# Altium schematic sheet Connector-USB-Current-Limit.SchDoc
size A4; SheetNumber: 2; SheetTotal: 5
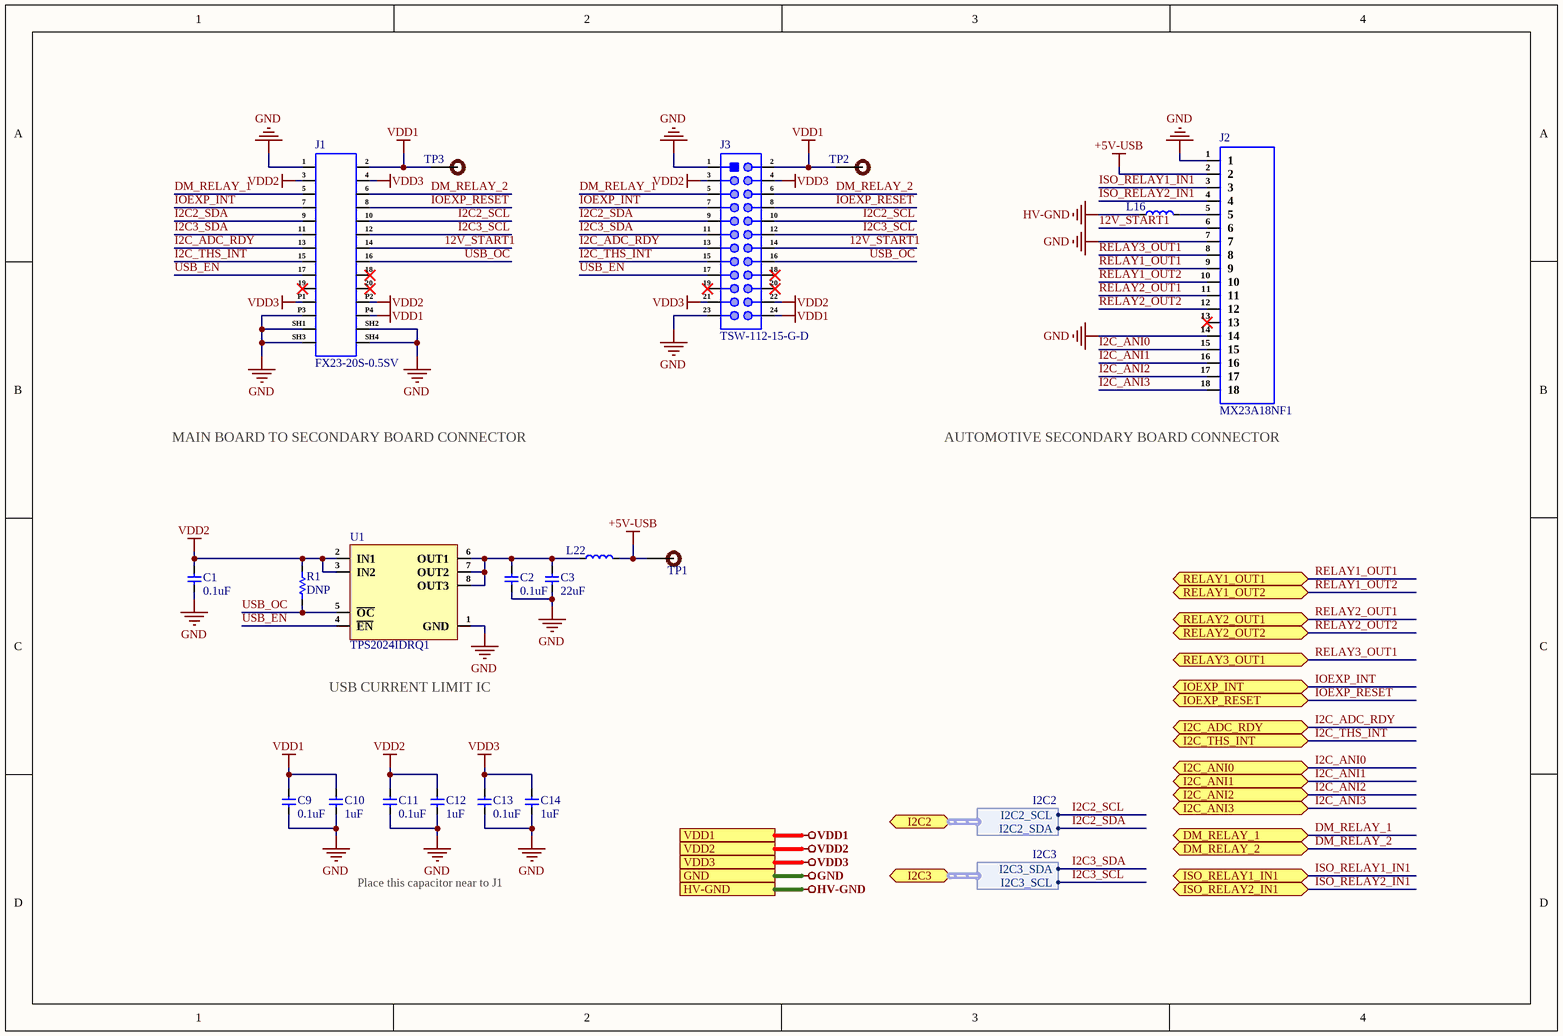
[diagram p0: Connector-USB-Current-Limit.SchDoc]

## Parts
C1  0.1uF  [Cap-0402]
C2  0.1uF  [Cap-0402]
C3  22uF  [Cap-0603]
C9  0.1uF  [Cap-0402]
C10  1uF  [Cap-0603]
C11  0.1uF  [Cap-0402]
C12  1uF  [Cap-0603]
C13  0.1uF  [Cap-0402]
C14  1uF  [Cap-0603]
J1  FX23-20S-0.5SV  [FX23-20S-0.5SV]
J2  MX23A18NF1  [MX23A18NF1]
J3  TSW-112-15-G-D  [TSW-112-15-G-D]
L16  BLM21SP601SH1D  [Ind-0805]  (value not drawn)
L22  BLM21SP601SH1D  [Ind-0805]  (value not drawn)
R1  DNP  [Res-0603]
TP1  DNP  [Test-point]  (value not drawn)
TP2  DNP  [Test-point]  (value not drawn)
TP3  DNP  [Test-point]  (value not drawn)
U1  TPS2024IDRQ1  [SOIC-8]

## Ports
DM_RELAY_1 (bidir, see Top-Sheet[3B], ISOLATED-RELAYS[4D]), DM_RELAY_2 (bidir, see Top-Sheet[3B], ISOLATED-RELAYS[4D]), GND (see Top-Sheet[2B], I2C-To-GPIO-Expander[1D], ISOLATED-RELAYS[1D], TEMP-HUMIDITY[1D]), HV-GND (see Top-Sheet[2B], ISOLATED-RELAYS[1D]), I2C2 (bidir, harness I2C2, see Top-Sheet[2C], I2C-To-GPIO-Expander[2D]), I2C3 (bidir, harness I2C3, see Top-Sheet[3C], TEMP-HUMIDITY[1D]), I2C_ADC_RDY (bidir, see Top-Sheet[3C], TEMP-HUMIDITY[2D]), I2C_ANI0 (bidir, see Top-Sheet[3C], TEMP-HUMIDITY[2D]), I2C_ANI1 (bidir, see Top-Sheet[3C], TEMP-HUMIDITY[2D]), I2C_ANI2 (bidir, see Top-Sheet[3C], TEMP-HUMIDITY[2D]), I2C_ANI3 (bidir, see Top-Sheet[3C], TEMP-HUMIDITY[2D]), I2C_THS_INT (bidir, see Top-Sheet[3C], TEMP-HUMIDITY[2D]), IOEXP_INT (bidir, see Top-Sheet[2C], I2C-To-GPIO-Expander[2D]), IOEXP_RESET (bidir, see Top-Sheet[2C], I2C-To-GPIO-Expander[2D]), ISO_RELAY1_IN1 (bidir, see Top-Sheet[3B], ISOLATED-RELAYS[4D]), ISO_RELAY2_IN1 (bidir, see Top-Sheet[3B], ISOLATED-RELAYS[4D]), RELAY1_OUT1 (bidir, see Top-Sheet[2C], I2C-To-GPIO-Expander[2C]), RELAY1_OUT2 (bidir, see Top-Sheet[2C], I2C-To-GPIO-Expander[2D]), RELAY2_OUT1 (bidir, see Top-Sheet[2C], I2C-To-GPIO-Expander[2D]), RELAY2_OUT2 (bidir, see Top-Sheet[2C], I2C-To-GPIO-Expander[2D]), RELAY3_OUT1 (bidir, see Top-Sheet[2C], I2C-To-GPIO-Expander[2D]), VDD1 (see Top-Sheet[2B], I2C-To-GPIO-Expander[1D]), VDD2 (see Top-Sheet[2C], I2C-To-GPIO-Expander[1D]), VDD3 (see Top-Sheet[2C], I2C-To-GPIO-Expander[1D], TEMP-HUMIDITY[1D])

## Harnesses
I2C3: I2C3_SDA, I2C3_SCL
I2C2: I2C2_SCL, I2C2_SDA

## Nets
+5V-USB: J2.2 L22.2 TP1.1
GND: C1.1 C2.1 C3.1 C9.1 C10.1 C11.1 C12.1 C13.1 C14.1 J1.1 J1.P3 J1.SH1 J1.SH2 J1.SH3 J1.SH4 J2.1 J2.7 J2.14 J3.1 J3.23 U1.1(GND) ; port GND
HV-GND: L16.1 ; port HV-GND
VDD1: C9.2 C10.2 J1.2 J1.P4 J3.2 J3.24 TP2.1 TP3.1 ; port VDD1
VDD2: C1.2 C11.2 C12.2 J1.3 J1.P2 J3.3 J3.22 R1.2 U1.2(IN1) U1.3(IN2) ; port VDD2
VDD3: C13.2 C14.2 J1.4 J1.P1 J3.4 J3.21 ; port VDD3
12V_START1: J1.14 J2.6 J3.14
DM_RELAY_1: J1.5 J3.5 ; port DM_RELAY_1
DM_RELAY_2: J1.6 J3.6 ; port DM_RELAY_2
I2C2_SCL: J1.10 J3.10 ; port I2C2.I2C2_SCL
I2C2_SDA: J1.9 J3.9 ; port I2C2.I2C2_SDA
I2C3_SCL: J1.12 J3.12 ; port I2C3.I2C3_SCL
I2C3_SDA: J1.11 J3.11 ; port I2C3.I2C3_SDA
I2C_ADC_RDY: J1.13 J3.13 ; port I2C_ADC_RDY
I2C_ANI0: J2.15 ; port I2C_ANI0
I2C_ANI1: J2.16 ; port I2C_ANI1
I2C_ANI2: J2.17 ; port I2C_ANI2
I2C_ANI3: J2.18 ; port I2C_ANI3
I2C_THS_INT: J1.15 J3.15 ; port I2C_THS_INT
IOEXP_INT: J1.7 J3.7 ; port IOEXP_INT
IOEXP_RESET: J1.8 J3.8 ; port IOEXP_RESET
ISO_RELAY1_IN1: J2.3 ; port ISO_RELAY1_IN1
ISO_RELAY2_IN1: J2.4 ; port ISO_RELAY2_IN1
RELAY1_OUT1: J2.9 ; port RELAY1_OUT1
RELAY1_OUT2: J2.10 ; port RELAY1_OUT2
RELAY2_OUT1: J2.11 ; port RELAY2_OUT1
RELAY2_OUT2: J2.12 ; port RELAY2_OUT2
RELAY3_OUT1: J2.8 ; port RELAY3_OUT1
USB_EN: J1.17 J3.17 U1.4(~{EN})
USB_OC: J1.16 J3.16 R1.1 U1.5(~{OC})
NetC2_2: C2.2 C3.2 L22.1 U1.6(OUT1) U1.7(OUT2) U1.8(OUT3)
NetJ2_5: J2.5 L16.2

Not connected (* = marked no-connect by the designer): J1 18* 19* 20*; J2 13*; J3 18* 19* 20*

## Notes on the sheet
- MAIN BOARD TO SECONDARY BOARD CONNECTOR
- (near J2) AUTOMOTIVE SECONDARY BOARD CONNECTOR
- (near U1) USB CURRENT LIMIT IC
- Place this capacitor near to J1

## Library data of the parts
C1 C2 C9 C11 C13 = GRM155R71C104KA88J: CAP CER 0.1UF 16V X7R 0402; Manufacturer: Murata; Material: 4241ConductorMaterial; Value: 100nF; Tolerance: 10%; Supplier: Arrow Electronics; Supplier Part Number: GRM155R71C104KA88J; Manufacturer Part Number: GRM155R71C104KA88J; RoHS: Yes; Category: Ceramic Capacitors; Stock: 300000; Pricing: 50000=0.004, 100000=0.0034, 150000=0.0033 (USD); Mounting Technology: Surface Mount; Case/Package: 0402; Pins: 2NUMBER; Case Code (Metric): 1005; Case Code (Imperial): 0402; Min Operating Temperature: -55°C; Max Operating Temperature: 125°C; Package Quantity: 1; Voltage Rating: 16V; Packaging: Tape and Reel; Dielectric: X7R; Voltage Rating (DC): 16V; Termination: SMD/SMT; Voltage: 16V; Series: GRM; Construction: Flat; Length: 1mm; Width: 0.02inch; Height: 0.5mm; Thickness: 0.022inch; Depth: 0.5mm; Radiation Hardening: No; Reach SVHC Compliant: No; Lead Free: Lead Free; RoHS Compliant: Yes; ComponentLink1URL: https://datasheet.ciiva.com/6271/product-6271168.pdf?src-supplier=Digi-Key; ComponentLink1Description: https://datasheet.ciiva.com/6271/product-6271168.pdf?src-supplier=Digi-Key; ComponentLink2URL: https://datasheet.ciiva.com/6271/grm155r71c104ka88-01-6271231.pdf?src-supplier=Digi-Key; ComponentLink2Description: https://datasheet.ciiva.com/6271/grm155r71c104ka88-01-6271231.pdf?src-supplier=Digi-Key
C3 = CL10A226MO7JZNC: CAP CER 22UF 16V X5R 0603; Manufacturer: Samsung; Tolerance: 20%; Supplier: Avnet; Supplier Part Number: CL10A226MO7JZNC; Manufacturer Part Number: CL10A226MO7JZNC; RoHS: Yes; Category: Ceramic Capacitors; Stock: 1192000; Pricing: 4000=0.1372 (USD); Mounting Technology: Surface Mount; Case/Package: 0603; Case Code (Imperial): 0603; Case Code (Metric): 1608; Min Operating Temperature: -55°C; Max Operating Temperature: 85°C; Packaging: Cut Tape; Value: 22uF; Voltage Rating: 16V; Series: CL; RoHS Compliant: Yes; ComponentLink1URL: http://www.samsungsem.com/kr/support/product-search/mlcc/CL10A226MO7JZNC.jsp?src-supplier=Digi-Key; ComponentLink1Description: http://www.samsungsem.com/kr/support/product-search/mlcc/CL10A226MO7JZNC.jsp?src-supplier=Digi-Key; ComponentLink2URL: https://datasheet.octopart.com/CL10A226MO7JZNC-Samsung-Electro-Mechanics-datasheet-149156497.pdf?src-supplier=Future+Electronics; ComponentLink2Description: https://datasheet.octopart.com/CL10A226MO7JZNC-Samsung-Electro-Mechanics-datasheet-149156497.pdf?src-supplier=Future+Electronics
C10 C12 C14 = CGA3E1X7R1E105K080AC: CAP CER 1UF 25V X7R 0603; Manufacturer: TDK; Material: 4241ConductorMaterial; Tolerance: 10%; Supplier: Rs; Supplier Part Number: 7882925P; Manufacturer Part Number: CGA3E1X7R1E105K080AC; RoHS: Yes; Category: Ceramic Capacitors; Stock: 80700; Pricing: 800=0.027, 2000=0.026 (GBP); Mounting Technology: Surface Mount; Case/Package: 0603; Case Code (Metric): 1608; Case Code (Imperial): 0603; Weight: 7.1E-05oz; Min Operating Temperature: -55°C; Max Operating Temperature: 125°C; Value: 1uF; Packaging: Tape and Reel; Dielectric: X7R; Voltage Rating: 25V; Package Quantity: 1; Voltage Rating (DC): 25V; Termination: SMD/SMT; Voltage: 25V; Series: CGA; Length: 1.6mm; Width: 0.031inch; Height: 0.8mm; Depth: 0.8mm; Thickness: 0.035inch; Ratings: AEC-Q200; Lead Free: Lead Free; Reach SVHC Compliant: No; RoHS Compliant: Yes; ComponentLink1URL: https://datasheet.ciiva.com/24216/cga3e1x7r1e105k080ac-265757-24216362.pdf?src-supplier=Mouser; ComponentLink1Description: https://datasheet.ciiva.com/24216/cga3e1x7r1e105k080ac-265757-24216362.pdf?src-supplier=Mouser; ComponentLink2URL: https://datasheet.ciiva.com/23803/1936565-23803078.pdf?src-supplier=Newark; ComponentLink2Description: https://datasheet.ciiva.com/23803/1936565-23803078.pdf?src-supplier=Newark; ComponentLink3URL: https://datasheet.ciiva.com/46385/1735392-46385705.pdf?src-supplier=Element14; ComponentLink3Description: https://datasheet.ciiva.com/46385/1735392-46385705.pdf?src-supplier=Element14; ComponentLink4URL: https://datasheet.ciiva.com/48573/2288cga3e1x7r1e105k080ac-48573708.pdf?src-supplier=Onlinecomponents.com; ComponentLink4Description: https://datasheet.ciiva.com/48573/2288cga3e1x7r1e105k080ac-48573708.pdf?src-supplier=Onlinecomponents.com; ComponentLink5URL: https://datasheet.ciiva.com/16428/mlccspec-automotive-general-midvoltage-en-16428542.pdf?src-supplier=Future+Electronics; ComponentLink5Description: https://datasheet.ciiva.com/16428/mlccspec-automotive-general-midvoltage-en-16428542.pdf?src-supplier=Future+Electronics
J1 = FX23-20S-0.5SV: CONN RCPT 20POS SMD GOLD; Manufacturer: Hirose; Supplier: Future Electronics; Supplier Part Number: 9113545; Manufacturer Part Number: FX23-20S-0.5SV; RoHS: Yes; Category: Board to Board Connectors; Stock: 84; Pricing: 84=1.74, 252=1.69, 336=1.68, 840=1.65, 1260=1.61 (USD); ComponentLink1URL: https://datasheet.octopart.com/FX23-20S-0.5SV-Hirose-datasheet-147827136.pdf?src-supplier=Future+Electronics; ComponentLink1Description: https://datasheet.octopart.com/FX23-20S-0.5SV-Hirose-datasheet-147827136.pdf?src-supplier=Future+Electronics; ComponentLink2URL: https://www.hirose.com/product/en/download_file/key_name/FX23-20S-0.5SV/category/Specification%20Sheet/doc_file_id/88096/?file_category_id=9&item_id=05733201000&is_series=&src-supplier=Digi-Key; ComponentLink2Description: https://www.hirose.com/product/en/download_file/key_name/FX23-20S-0.5SV/category/Specification%20Sheet/doc_file_id/88096/?file_category_id=9&item_id=05733201000&is_series=&src-supplier=Digi-Key; ComponentLink3URL: https://datasheet.octopart.com/FX23-20S-0.5SV-Hirose-datasheet-155938459.pdf?src-supplier=Sager+Electronics; ComponentLink3Description: https://datasheet.octopart.com/FX23-20S-0.5SV-Hirose-datasheet-155938459.pdf?src-supplier=Sager+Electronics
J2 = MX23A18NF1: CONN HEADER R/A 18POS 2.5MM; Manufacturer: JAE Electronics; Supplier: Rs; Supplier Part Number: 435784; Manufacturer Part Number: MX23A18NF1; RoHS: Yes; Category: Connectors; Stock: 117; Pricing: 1=6.45, 10=6.27, 25=6.1, 50=5.93, 75=5.78 (GBP); ComponentLink1URL: https://datasheet.ciiva.com/11754/0900766b80b7ac1f-11754128.pdf?src-supplier=Rs; ComponentLink1Description: https://datasheet.ciiva.com/11754/0900766b80b7ac1f-11754128.pdf?src-supplier=Rs; ComponentLink2URL: https://datasheet.ciiva.com/732/transportation-pg-v2-2-732928.pdf?src-supplier=Digi-Key; ComponentLink2Description: https://datasheet.ciiva.com/732/transportation-pg-v2-2-732928.pdf?src-supplier=Digi-Key
J3 = TSW-112-15-G-D: CONN HEADER VERT 24POS 2.54MM; Manufacturer: Samtec; Supplier: Digi-Key; Supplier Part Number: SAM12353-ND; Manufacturer Part Number: TSW-112-15-G-D; RoHS: Yes; Category: Connectors; Stock: 706; Pricing: 1=4.12, 10=3.737, 100=3.2926, 500=2.79872, 1000=2.38714 (USD); ComponentLink1URL: http://www.farnell.com/datasheets/2060109.pdf?src-supplier=Farnell; ComponentLink1Description: http://www.farnell.com/datasheets/2060109.pdf?src-supplier=Farnell; ComponentLink2URL: http://suddendocs.samtec.com/prints/tsw-xxx-xx-xxx-x-xx-xxx-mkt.pdf?src-supplier=Digi-Key; ComponentLink2Description: http://suddendocs.samtec.com/prints/tsw-xxx-xx-xxx-x-xx-xxx-mkt.pdf?src-supplier=Digi-Key; ComponentLink3URL: https://datasheet.octopart.com/TSW-112-15-G-D-Samtec-datasheet-97325576.pdf?src-supplier=Sager+Electronics; ComponentLink3Description: https://datasheet.octopart.com/TSW-112-15-G-D-Samtec-datasheet-97325576.pdf?src-supplier=Sager+Electronics
L16 L22 = BLM21SP601SH1D: FERRITE BEAD 600 OHM 0805 1LN; Manufacturer: Murata; Supplier: Arrow Electronics; Supplier Part Number: BLM21SP601SH1D; Manufacturer Part Number: BLM21SP601SH1D; RoHS: Yes; Category: Ferrite Beads and Chips; Stock: 60000; Pricing: 4000=0.0948 (USD); ComponentLink1URL: https://www.murata.com/en-us/api/pdfdownloadapi?cate=luNoiseSupprFilteChipFerriBead&amp;partno=BLM21SP601SH1%23&src-supplier=Digi-Key; ComponentLink1Description: https://www.murata.com/en-us/api/pdfdownloadapi?cate=luNoiseSupprFilteChipFerriBead&amp;partno=BLM21SP601SH1%23&src-supplier=Digi-Key; ComponentLink2URL: https://datasheet.octopart.com/BLM21SP601SH1D-Murata-datasheet-138707483.pdf?src-supplier=Future+Electronics; ComponentLink2Description: https://datasheet.octopart.com/BLM21SP601SH1D-Murata-datasheet-138707483.pdf?src-supplier=Future+Electronics; ComponentLink3URL: https://datasheet.octopart.com/BLM21SP601SH1D-Murata-datasheet-166171483.pdf?src-supplier=TME; ComponentLink3Description: https://datasheet.octopart.com/BLM21SP601SH1D-Murata-datasheet-166171483.pdf?src-supplier=TME
R1 = RCA060310K0FKEAHP: RES SMD 10K OHM 1% 1/10W 0603; Manufacturer: Vishay Dale; Value: 10kR; Max Power Dissipation: 250mW; Temperature Coefficient: 100ppm/°C; Supplier: Future Electronics; Supplier Part Number: 4171415; Manufacturer Part Number: RCA060310K0FKEAHP; RoHS: Yes; Category: Chip SMD Resistors; Stock: 10000; Pricing: 5000=0.0413, 10000=0.0403, 15000=0.0397, 25000=0.0389, 50000=0.0374 (USD); Case/Package: 0603; Case Code (Imperial): 0603; Case Code (Metric): 1608; Min Operating Temperature: -55°C; Max Operating Temperature: 155°C; Features: Automotive AEC-Q200,Anti-Sulfur; Packaging: Cut Tape; Tolerance: 1%; Number of Terminations: 2; Series: RCA-HP; Ratings: AEC-Q200; RoHS Compliant: Yes; ComponentLink1URL: http://www.vishay.com/docs/20067/rcahp.pdf?src-supplier=Digi-Key; ComponentLink1Description: http://www.vishay.com/docs/20067/rcahp.pdf?src-supplier=Digi-Key
TP1-TP3 = TEST POINT: Test Point ON; Item Type: TEST POINT
U1 = TPS2024IDRQ1: IC PWR SWITCH N-CHAN 1:1 8SOIC; Manufacturer: Texas Instruments; Supplier: Mouser; Supplier Part Number: 595-TPS2024IDRQ1; Manufacturer Part Number: TPS2024IDRQ1; RoHS: Yes; Category: Hot Swap Controllers; Stock: 4908; Pricing: 1=2.71, 10=2.44, 50=2.44, 100=1.96, 1000=1.34, 10000=1.13 (USD); ComponentLink1URL: https://datasheet.ciiva.com/3235/tps2022-q1-3235178.pdf?src-supplier=Avnet; ComponentLink1Description: https://datasheet.ciiva.com/3235/tps2022-q1-3235178.pdf?src-supplier=Avnet; ComponentLink2URL: https://datasheet.ciiva.com/1963/tps2022-q1-1963779.pdf?src-supplier=Digi-Key; ComponentLink2Description: https://datasheet.ciiva.com/1963/tps2022-q1-1963779.pdf?src-supplier=Digi-Key